# Altium schematic sheet RELE.SchDoc: ИЛ1428ТО1/1
size 410 x 297 mm; ApprovedBy: Стерхов В.Д.; CheckedBy: Стерхов В.Д.; Author: Сергеев Д.А.; CompanyName: ГК "СНАБЖЕНИЕ"; DrawnBy: Сергеев Д.А.; Engineer: Сергеев Д.А.; Organization: ГК "СНАБЖЕНИЕ"; DocumentNumber: ИЛ1428ТО1/1; Revision: 1; SheetNumber: 4; SheetTotal: 5
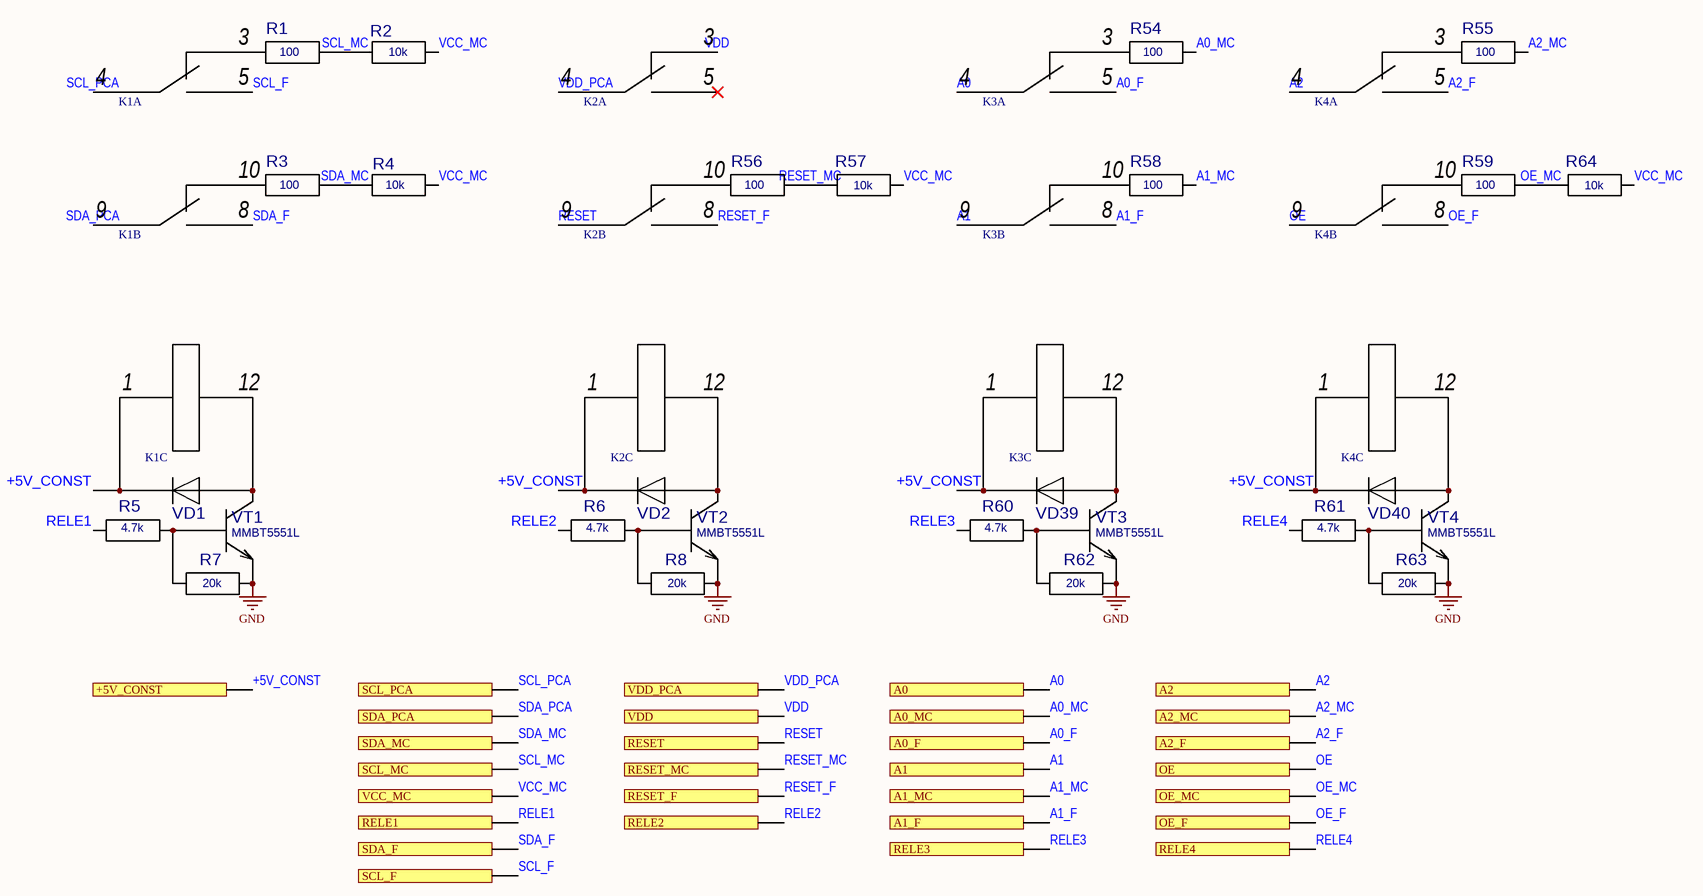
[diagram p0: RELE.SchDoc]

## Parts
K1  V23079A1001B301 TE  [V23079A1001B301]  (value not drawn)  (parts A,B,C of 3)
K2  V23079A1001B301 TE  [V23079A1001B301]  (value not drawn)  (parts A,B,C of 3)
K3  V23079A1001B301 TE  [V23079A1001B301]  (value not drawn)  (parts A,B,C of 3)
K4  V23079A1001B301 TE  [V23079A1001B301]  (value not drawn)  (parts A,B,C of 3)
R1  100  [0805]
R2  10k  [0805]
R3  100  [0805]
R4  10k  [0805]
R5  4.7k  [0805]
R6  4.7k  [0805]
R7  20k  [0805]
R8  20k  [0805]
R54  100  [0805]
R55  100  [0805]
R56  100  [0805]
R57  10k  [0805]
R58  100  [0805]
R59  100  [0805]
R60  4.7k  [0805]
R61  4.7k  [0805]
R62  20k  [0805]
R63  20k  [0805]
R64  10k  [0805]
VD1  LL4148 NXP  [SOD80C]  (value not drawn)
VD2  LL4148 NXP  [SOD80C]  (value not drawn)
VD39  LL4148 NXP  [SOD80C]  (value not drawn)
VD40  LL4148 NXP  [SOD80C]  (value not drawn)
VT1  MMBT5551L  [SOT-23]
VT2  MMBT5551L  [SOT-23]
VT3  MMBT5551L  [SOT-23]
VT4  MMBT5551L  [SOT-23]

## Ports
+5V_CONST, A0, A0_F, A0_MC, A1, A1_F, A1_MC, A2, A2_F, A2_MC, OE, OE_F, OE_MC, RELE1, RELE2, RELE3, RELE4, RESET, RESET_F, RESET_MC, SCL_F, SCL_MC, SCL_PCA, SDA_F, SDA_MC, SDA_PCA, VCC_MC, VDD, VDD_PCA

## Nets
GND: R7.2 R8.2 R62.2 R63.2 VT1.2(E) VT2.2(E) VT3.2(E) VT4.2(E)
+5V_CONST: K1.1 K2.1 K3.1 K4.1 VD1.2(K) VD2.2(K) VD39.2(K) VD40.2(K) ; port +5V_CONST
A0: K3.4 ; port A0
A0_F: K3.5 ; port A0_F
A0_MC: R54.2 ; port A0_MC
A1: K3.9 ; port A1
A1_F: K3.8 ; port A1_F
A1_MC: R58.2 ; port A1_MC
A2: K4.4 ; port A2
A2_F: K4.5 ; port A2_F
A2_MC: R55.2 ; port A2_MC
OE: K4.9 ; port OE
OE_F: K4.8 ; port OE_F
OE_MC: R59.2 R64.1 ; port OE_MC
RELE1: R5.1 ; port RELE1
RELE2: R6.1 ; port RELE2
RELE3: R60.1 ; port RELE3
RELE4: R61.1 ; port RELE4
RESET: K2.9 ; port RESET
RESET_F: K2.8 ; port RESET_F
RESET_MC: R56.2 R57.1 ; port RESET_MC
SCL_F: K1.5 ; port SCL_F
SCL_MC: R1.2 R2.1 ; port SCL_MC
SCL_PCA: K1.4 ; port SCL_PCA
SDA_F: K1.8 ; port SDA_F
SDA_MC: R3.2 R4.1 ; port SDA_MC
SDA_PCA: K1.9 ; port SDA_PCA
VCC_MC: R2.2 R4.2 R57.2 R64.2 ; port VCC_MC
VDD: K2.3 ; port VDD
VDD_PCA: K2.4 ; port VDD_PCA
NetK1_3: K1.3 R1.1
NetK1_10: K1.10 R3.1
NetK1_12: K1.12 VD1.1(A) VT1.3(K)
NetK2_10: K2.10 R56.1
NetK2_12: K2.12 VD2.1(A) VT2.3(K)
NetK3_3: K3.3 R54.1
NetK3_10: K3.10 R58.1
NetK3_12: K3.12 VD39.1(A) VT3.3(K)
NetK4_3: K4.3 R55.1
NetK4_10: K4.10 R59.1
NetK4_12: K4.12 VD40.1(A) VT4.3(K)
NetR5_2: R5.2 R7.1 VT1.1(B)
NetR6_2: R6.2 R8.1 VT2.1(B)
NetR60_2: R60.2 R62.1 VT3.1(B)
NetR61_2: R61.2 R63.1 VT4.1(B)

Not connected (* = marked no-connect by the designer): K2 5*

## Notes on the sheet
- Подп. и дата
- Инв. № дубл.
- Взам. инв. №
- Инв. № подл.
- Изм.
- Лист
- № докум.
- Подп.
- Дата
- Форма 2а ГОСТ 2.104-2006
- Копировал
- Формат А3

## Library data of the parts
R1-R8 R54-R64 = R0805 Yageo: ComponentHeigt: 0.6; Firme: Yageo; Leadform: SMD; Kind: Резистор; ClassName: *; ComponentWeigt: *; Component Link: *; Packaging: 0805; NN: *; Value: *
VD1 VD2 VD39 VD40 = LL4148 NXP: ComponentHeigt: 1.6; Leadform: SMD; NN: 24009301; KIND: Диод LL4148 NXP; Component Link: http://www.nxp.com; Packaging: SOD-80C; ClassName: *; Firme: NXP
VT1-VT4 = MMBT5551L: ComponentHeigt: 1.1; Firme: ONS; Leadform: SMD; NN: 24007468; KIND: Транзистор MMBT5551L*G ONS; ClassName: *; ComponentWeigt: *; Packaging: SOT-23